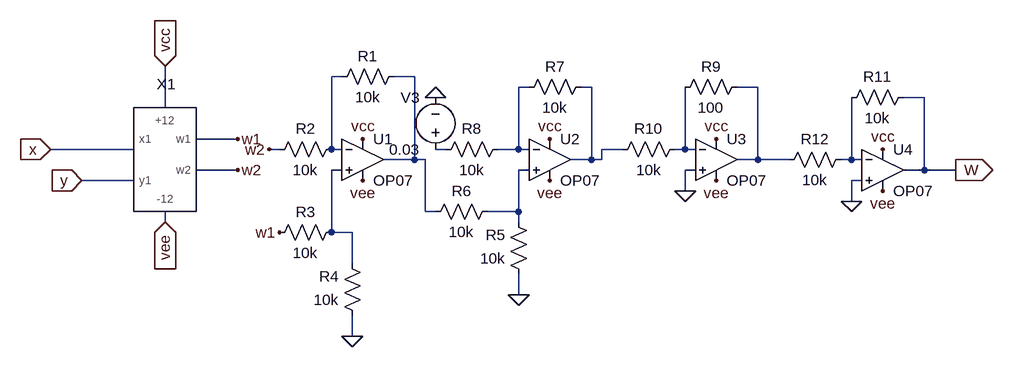
[diagram p0: schematic test_mul_2.asc]
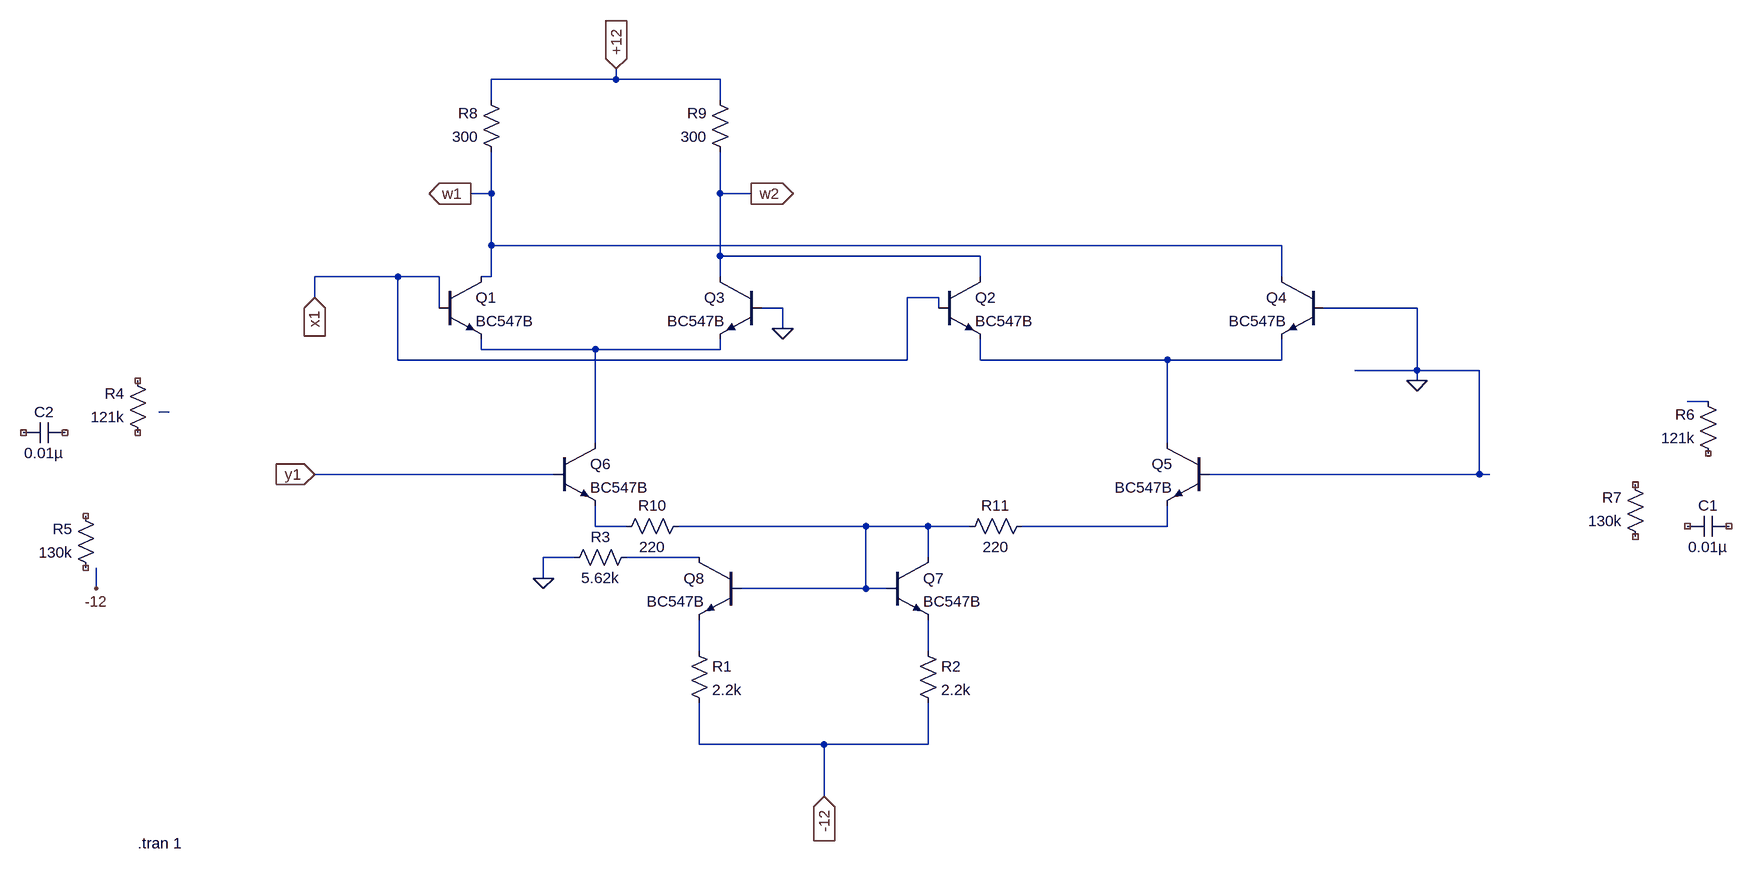
[diagram p1: sub-circuit multipeir_3.asc]
test_mul_2.asc, the LTspice schematic file:
Version 4.1
SHEET 1 900 680
WIRE -128 -32 -144 -32
WIRE -16 -32 -48 -32
WIRE 160 -16 144 -16
WIRE 256 -16 240 -16
WIRE 512 -16 480 -16
WIRE 768 0 736 0
WIRE -400 16 -400 -48
WIRE -288 64 -352 64
WIRE -448 80 -448 64
WIRE -448 80 -576 80
WIRE -224 80 -240 80
WIRE -144 80 -144 -32
WIRE -128 80 -144 80
WIRE 32 80 16 80
WIRE 144 80 144 -16
WIRE 144 80 112 80
WIRE 160 80 144 80
WIRE 304 80 272 80
WIRE 400 80 400 -16
WIRE 400 80 384 80
WIRE 416 80 400 80
WIRE -16 96 -16 -32
WIRE -16 96 -64 96
WIRE 0 96 -16 96
WIRE 256 96 256 -16
WIRE 256 96 224 96
WIRE 272 96 272 80
WIRE 272 96 256 96
WIRE 512 96 512 -16
WIRE 512 96 480 96
WIRE 560 96 512 96
WIRE 656 96 656 0
WIRE 656 96 640 96
WIRE 672 96 656 96
WIRE -288 112 -352 112
WIRE -128 112 -144 112
WIRE 160 112 144 112
WIRE 416 112 400 112
WIRE 768 112 768 0
WIRE 768 112 736 112
WIRE 816 112 768 112
WIRE -448 128 -528 128
WIRE 672 128 656 128
WIRE 400 144 400 112
WIRE 656 160 656 128
WIRE 0 176 0 96
WIRE 16 176 0 176
WIRE 144 176 144 112
WIRE 144 176 96 176
WIRE -400 192 -400 176
WIRE 144 192 144 176
WIRE -144 208 -144 112
WIRE -112 208 -144 208
WIRE -112 256 -112 208
WIRE 144 304 144 272
WIRE -112 368 -112 336
FLAG -288 64 w1
FLAG -288 112 w2
FLAG -112 368 0
FLAG -240 80 w2
FLAG -224 208 w1
FLAG 400 144 0
FLAG 144 304 0
FLAG -400 -48 vcc
IOPIN -400 -48 In
FLAG -96 64 vcc
FLAG 192 64 vcc
FLAG 448 64 vcc
FLAG 448 128 vee
FLAG 192 128 vee
FLAG -96 128 vee
FLAG -400 192 vee
IOPIN -400 192 In
FLAG 16 0 0
FLAG 656 160 0
FLAG 704 80 vcc
FLAG 704 144 vee
FLAG -576 80 x
IOPIN -576 80 In
FLAG -528 128 y
IOPIN -528 128 In
FLAG 816 112 W
IOPIN 816 112 Out
SYMBOL multipeir_3 -400 96 R0
SYMATTR InstName X1
SYMBOL OpAmps\\OP07 -96 32 R0
SYMATTR InstName U1
SYMBOL OpAmps\\OP07 192 32 R0
SYMATTR InstName U2
SYMBOL OpAmps\\OP07 448 32 R0
SYMATTR InstName U3
SYMBOL res -32 -48 R90
WINDOW 0 0 56 VBottom 2
WINDOW 3 32 56 VTop 2
SYMATTR InstName R1
SYMATTR Value 10k
SYMBOL res -128 64 R90
WINDOW 0 0 56 VBottom 2
WINDOW 3 32 56 VTop 2
SYMATTR InstName R2
SYMATTR Value 10k
SYMBOL res -128 192 R90
WINDOW 0 0 56 VBottom 2
WINDOW 3 32 56 VTop 2
SYMATTR InstName R3
SYMATTR Value 10k
SYMBOL res -96 352 R180
WINDOW 0 36 76 Left 2
WINDOW 3 36 40 Left 2
SYMATTR InstName R4
SYMATTR Value 10k
SYMBOL res 160 288 R180
WINDOW 0 36 76 Left 2
WINDOW 3 36 40 Left 2
SYMATTR InstName R5
SYMATTR Value 10k
SYMBOL res 0 192 R270
WINDOW 0 32 56 VTop 2
WINDOW 3 0 56 VBottom 2
SYMATTR InstName R6
SYMATTR Value 10k
SYMBOL res 144 0 R270
WINDOW 0 32 56 VTop 2
WINDOW 3 0 56 VBottom 2
SYMATTR InstName R7
SYMATTR Value 10k
SYMBOL res 16 96 R270
WINDOW 0 32 56 VTop 2
WINDOW 3 0 56 VBottom 2
SYMATTR InstName R8
SYMATTR Value 10k
SYMBOL res 496 -32 R90
WINDOW 0 0 56 VBottom 2
WINDOW 3 32 56 VTop 2
SYMATTR InstName R9
SYMATTR Value 100
SYMBOL res 400 64 R90
WINDOW 0 0 56 VBottom 2
WINDOW 3 32 56 VTop 2
SYMATTR InstName R10
SYMATTR Value 10k
SYMBOL voltage 16 96 R180
WINDOW 0 24 96 Left 2
WINDOW 3 24 16 Left 2
WINDOW 123 0 0 Left 0
WINDOW 39 0 0 Left 0
SYMATTR InstName V3
SYMATTR Value 0.03
SYMBOL OpAmps\\OP07 704 48 R0
SYMATTR InstName U4
SYMBOL res 752 -16 R90
WINDOW 0 0 56 VBottom 2
WINDOW 3 32 56 VTop 2
SYMATTR InstName R11
SYMATTR Value 10k
SYMBOL res 656 80 R90
WINDOW 0 0 56 VBottom 2
WINDOW 3 32 56 VTop 2
SYMATTR InstName R12
SYMATTR Value 10k

multipeir_3.asc, the sub-circuit schematic file:
Version 4.1
SHEET 1 2080 996
WIRE 240 -208 240 -224
WIRE 240 -208 48 -208
WIRE 400 -208 240 -208
WIRE 48 -176 48 -208
WIRE 400 -176 400 -208
WIRE 48 -32 48 -96
WIRE 48 -32 16 -32
WIRE 400 -32 400 -96
WIRE 448 -32 400 -32
WIRE 48 48 48 -32
WIRE 1264 48 48 48
WIRE 400 64 400 -32
WIRE 800 64 400 64
WIRE -96 96 -224 96
WIRE -32 96 -96 96
WIRE 48 96 48 48
WIRE 48 96 32 96
WIRE 400 96 400 64
WIRE 800 96 800 64
WIRE 1264 96 1264 48
WIRE -224 128 -224 96
WIRE 736 128 688 128
WIRE -32 144 -32 96
WIRE 496 144 464 144
WIRE 736 144 736 128
WIRE 1472 144 1328 144
WIRE 496 176 496 144
WIRE 32 208 32 192
WIRE 208 208 32 208
WIRE 400 208 400 192
WIRE 400 208 208 208
WIRE -96 224 -96 96
WIRE 688 224 688 128
WIRE 688 224 -96 224
WIRE 800 224 800 192
WIRE 1088 224 800 224
WIRE 1264 224 1264 192
WIRE 1264 224 1088 224
WIRE 1472 240 1472 144
WIRE 1472 240 1376 240
WIRE 1568 240 1472 240
WIRE 1472 256 1472 240
WIRE 1920 288 1888 288
WIRE -448 304 -464 304
WIRE 208 352 208 208
WIRE 1088 352 1088 224
WIRE 144 400 -224 400
WIRE 1568 400 1568 240
WIRE 1568 400 1152 400
WIRE 1584 400 1568 400
WIRE 208 480 208 448
WIRE 256 480 208 480
WIRE 624 480 336 480
WIRE 720 480 624 480
WIRE 784 480 720 480
WIRE 1088 480 1088 448
WIRE 1088 480 864 480
WIRE 176 528 128 528
WIRE 368 528 256 528
WIRE 720 528 720 480
WIRE 128 560 128 528
WIRE -560 576 -560 544
WIRE 624 576 624 480
WIRE 624 576 432 576
WIRE 656 576 624 576
WIRE 368 672 368 624
WIRE 720 672 720 624
WIRE 368 816 368 752
WIRE 560 816 368 816
WIRE 720 816 720 752
WIRE 720 816 560 816
WIRE 560 896 560 816
FLAG 1472 256 0
FLAG 128 560 0
FLAG -560 576 -12
FLAG 496 176 0
FLAG 240 -224 +12
IOPIN 240 -224 In
FLAG 560 896 -12
IOPIN 560 896 In
FLAG -224 128 x1
IOPIN -224 128 In
FLAG -224 400 y1
IOPIN -224 400 In
FLAG 16 -32 w1
IOPIN 16 -32 Out
FLAG 448 -32 w2
IOPIN 448 -32 Out
SYMBOL npn -32 96 R0
SYMATTR InstName Q1
SYMATTR Value BC547B
SYMBOL npn 736 96 R0
SYMATTR InstName Q2
SYMATTR Value BC547B
SYMBOL npn 464 96 M0
SYMATTR InstName Q3
SYMATTR Value BC547B
SYMBOL npn 1328 96 M0
SYMATTR InstName Q4
SYMATTR Value BC547B
SYMBOL npn 1152 352 M0
SYMATTR InstName Q5
SYMATTR Value BC547B
SYMBOL npn 144 352 R0
SYMATTR InstName Q6
SYMATTR Value BC547B
SYMBOL npn 656 528 R0
SYMATTR InstName Q7
SYMATTR Value BC547B
SYMBOL npn 432 528 M0
SYMATTR InstName Q8
SYMATTR Value BC547B
SYMBOL res 352 656 R0
SYMATTR InstName R1
SYMATTR Value 2.2k
SYMBOL res 704 656 R0
SYMATTR InstName R2
SYMATTR Value 2.2k
SYMBOL res 272 512 R90
WINDOW 0 0 56 VBottom 2
WINDOW 3 32 56 VTop 2
SYMATTR InstName R3
SYMATTR Value 5.62k
SYMBOL res -480 352 R180
WINDOW 0 36 76 Left 2
WINDOW 3 36 40 Left 2
SYMATTR InstName R4
SYMATTR Value 121k
SYMATTR SpiceLine tol=0 pwr=0
SYMBOL res -560 560 R180
WINDOW 0 36 76 Left 2
WINDOW 3 36 40 Left 2
SYMATTR InstName R5
SYMATTR Value 130k
SYMBOL res 1936 384 R180
WINDOW 0 36 76 Left 2
WINDOW 3 36 40 Left 2
SYMATTR InstName R6
SYMATTR Value 121k
SYMBOL res 1824 512 R180
WINDOW 0 36 76 Left 2
WINDOW 3 36 40 Left 2
SYMATTR InstName R7
SYMATTR Value 130k
SYMBOL res 64 -80 R180
WINDOW 0 36 76 Left 2
WINDOW 3 36 40 Left 2
SYMATTR InstName R8
SYMATTR Value 300
SYMBOL res 416 -80 R180
WINDOW 0 36 76 Left 2
WINDOW 3 36 40 Left 2
SYMATTR InstName R9
SYMATTR Value 300
SYMBOL cap 1952 464 R90
WINDOW 0 0 32 VBottom 2
WINDOW 3 32 32 VTop 2
SYMATTR InstName C1
SYMATTR Value 0.01µ
SYMBOL cap -608 320 R90
WINDOW 0 0 32 VBottom 2
WINDOW 3 32 32 VTop 2
SYMATTR InstName C2
SYMATTR Value 0.01µ
SYMBOL res 352 464 R90
WINDOW 0 0 56 VBottom 2
WINDOW 3 32 56 VTop 2
SYMATTR InstName R10
SYMATTR Value 220
SYMBOL res 880 464 R90
WINDOW 0 0 56 VBottom 2
WINDOW 3 32 56 VTop 2
SYMATTR InstName R11
SYMATTR Value 220
TEXT -496 968 Left 2 !.tran 1

The netlist it stands for:
* test_mul_2.asc
X§X1 vcc vee x y w2 w1 multipeir_3
X§U1 N009 N001 vcc vee N002 LT1001  ; OP07, pins In+ In- V+ V- OUT
X§U2 N010 N003 vcc vee N004 LT1001  ; OP07, pins In+ In- V+ V- OUT
X§U3 0 N007 vcc vee N005 LT1001  ; OP07, pins In+ In- V+ V- OUT
R1 N002 N001 10k
R2 N001 w2 10k
R3 N009 w1 10k
R4 0 N009 10k
R5 0 N010 10k
R6 N002 N010 10k
R7 N003 N004 10k
R8 N006 N003 10k
R9 N005 N007 100
R10 N007 N004 10k
V3 N006 0 0.03
X§U4 0 N008 vcc vee W LT1001  ; OP07, pins In+ In- V+ V- OUT
R11 W N008 10k
R12 N008 N005 10k

* block symbol definitions
.subckt multipeir_3 +12 -12 x1 y1 w2 w1
Q1 w1 x1 N001 0 BC547B
Q2 w2 x1 N002 0 BC547B
Q3 w2 0 N001 0 BC547B
Q4 w1 0 N002 0 BC547B
Q5 N002 0 N007 0 BC547B
Q6 N001 y1 N005 0 BC547B
Q7 N006 N006 N010 0 BC547B
Q8 N008 N006 N009 0 BC547B
R1 N009 -12 2.2k
R2 N010 -12 2.2k
R3 N008 0 5.62k
R4 NC_01 NC_02 121k tol=0 pwr=0
R5 NC_03 NC_04 130k
R6 NC_05 N003 121k
R7 NC_06 NC_07 130k
R8 w1 +12 300
R9 w2 +12 300
C1 NC_08 NC_09 0.01µ
C2 NC_10 NC_11 0.01µ
R10 N006 N005 220
R11 N007 N006 220
.tran 1
.ends multipeir_3

.model NPN NPN
.model PNP PNP
.lib standard.bjt
.lib LTC.lib
.backanno
.end